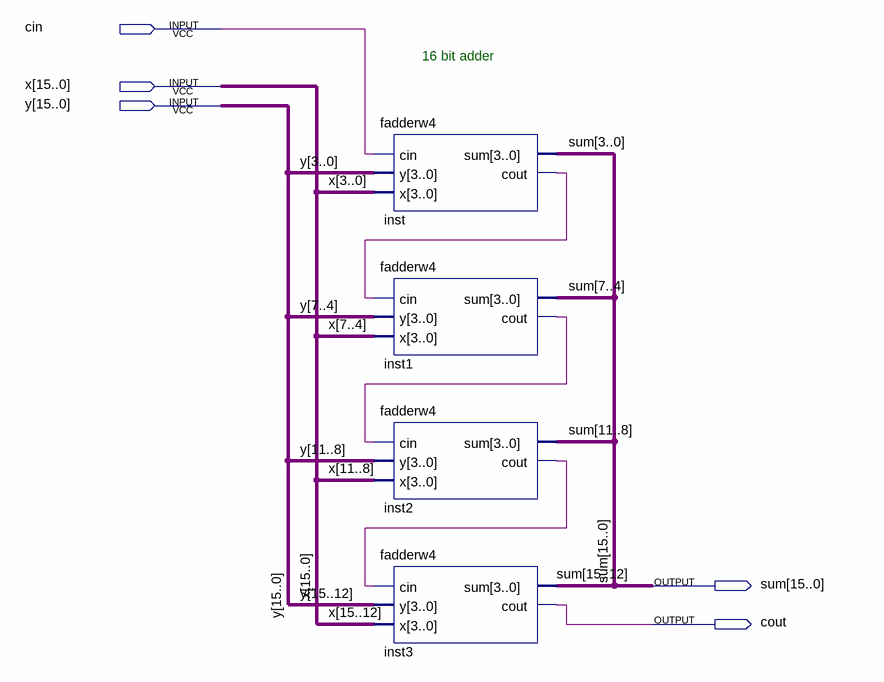
[diagram p0: schematic sheet]
// Quartus schematic fadderw16.bdf as structural Verilog: 4 symbols, 5 pins
module fadderw16 (
  input  cin,
  input  [15:0] x,
  input  [15:0] y,
  output [15:0] sum,
  output cout
);

  wire inst1_cout, inst2_cout, inst_cout;

  fadderw4 inst (.cin(cin), .y(y[3:0]), .x(x[3:0]), .sum(sum[3:0]), .cout(inst_cout));
  fadderw4 inst1 (.cin(inst_cout), .y(y[7:4]), .x(x[7:4]), .sum(sum[7:4]), .cout(inst1_cout));
  fadderw4 inst2 (.cin(inst1_cout), .y(y[11:8]), .x(x[11:8]), .sum(sum[11:8]), .cout(inst2_cout));
  fadderw4 inst3 (.cin(inst2_cout), .y(y[15:12]), .x(x[15:12]), .sum(sum[15:12]), .cout(cout));

  // Notes on the sheet:
  //   16 bit adder
endmodule
